# Altium schematic sheet Top-Sheet.SchDoc
size A4; SheetNumber: 1; SheetTotal: 9
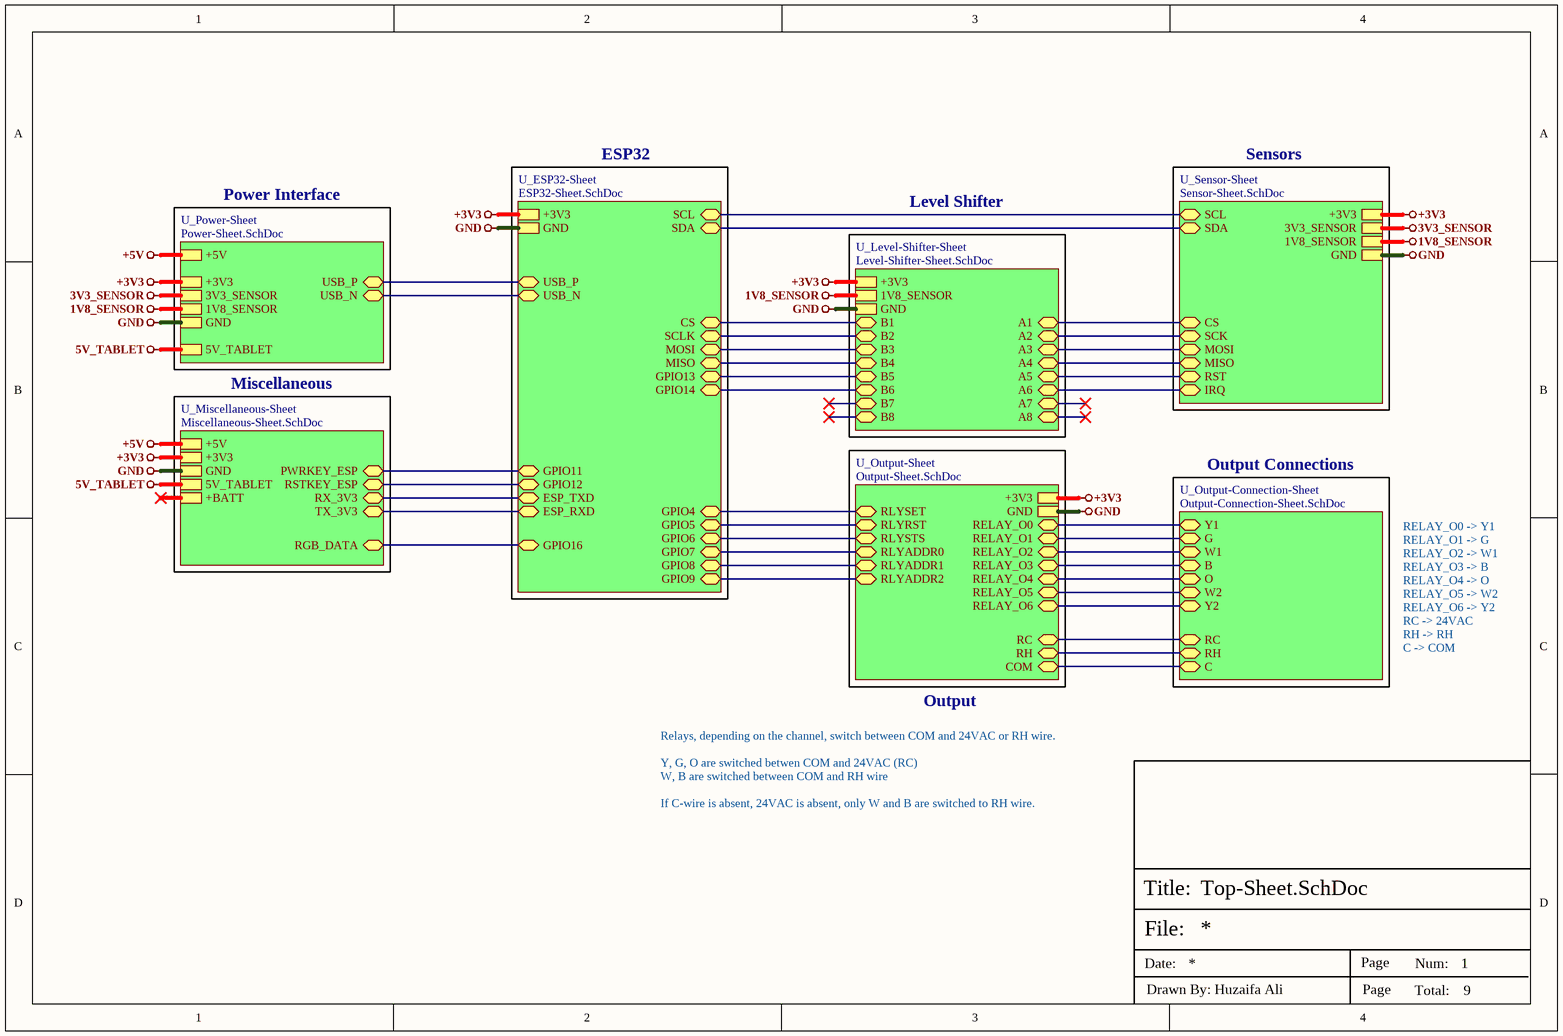
[diagram p0: Top-Sheet.SchDoc]

## Sub-sheets
U_ESP32-Sheet = ESP32-Sheet.SchDoc: +3V3, GND, USB_P (bidir), USB_N (bidir), GPIO11 (bidir), GPIO12 (bidir), ESP_TXD (bidir), ESP_RXD (bidir), GPIO16 (bidir), SCL (bidir), SDA (bidir), CS (bidir), SCLK (bidir), MOSI (bidir), MISO (bidir), GPIO13 (bidir), GPIO14 (bidir), GPIO4 (bidir), GPIO5 (bidir), GPIO6 (bidir), GPIO7 (bidir), GPIO8 (bidir), GPIO9 (bidir)
U_Level-Shifter-Sheet = Level-Shifter-Sheet.SchDoc: +3V3, 1V8_SENSOR, GND, A1 (bidir), A2 (bidir), A3 (bidir), A4 (bidir), A5 (bidir), A6 (bidir), A7 (bidir), A8 (bidir), B1 (bidir), B2 (bidir), B3 (bidir), B4 (bidir), B5 (bidir), B6 (bidir), B7 (bidir), B8 (bidir)
U_Miscellaneous-Sheet = Miscellaneous-Sheet.SchDoc: +5V, +3V3, GND, 5V_TABLET, PWRKEY_ESP (bidir), RSTKEY_ESP (bidir), RX_3V3 (bidir), TX_3V3 (bidir), RGB_DATA (bidir), +BATT
U_Output-Connection-Sheet = Output-Connection-Sheet.SchDoc: Y1 (bidir), G (bidir), W1 (bidir), RC (bidir), RH (bidir), B (bidir), O (bidir), W2 (bidir), Y2 (bidir), C (bidir)
U_Output-Sheet = Output-Sheet.SchDoc: +3V3, GND, RLYSET (bidir), RLYRST (bidir), RLYSTS (bidir), RLYADDR0 (bidir), RLYADDR1 (bidir), RLYADDR2 (bidir), RELAY_O0 (bidir), RELAY_O1 (bidir), RELAY_O2 (bidir), RELAY_O3 (bidir), RELAY_O4 (bidir), RELAY_O5 (bidir), RELAY_O6 (bidir), RC (bidir), RH (bidir), COM (bidir)
U_Power-Sheet = Power-Sheet.SchDoc: +5V, 5V_TABLET, +3V3, 3V3_SENSOR, 1V8_SENSOR, GND, USB_P (bidir), USB_N (bidir)
U_Sensor-Sheet = Sensor-Sheet.SchDoc: +3V3, 3V3_SENSOR, 1V8_SENSOR, GND, SDA (bidir), SCL (bidir), IRQ (bidir), RST (bidir), CS (bidir), SCK (bidir), MOSI (bidir), MISO (bidir)

## Nets
1V8_SENSOR: sheet U_Power-Sheet/1V8_SENSOR, sheet U_Sensor-Sheet/1V8_SENSOR, sheet U_Level-Shifter-Sheet/1V8_SENSOR
3V3_SENSOR: sheet U_Power-Sheet/3V3_SENSOR, sheet U_Sensor-Sheet/3V3_SENSOR
5V_TABLET: sheet U_Power-Sheet/5V_TABLET, sheet U_Miscellaneous-Sheet/5V_TABLET
+3V3: sheet U_Power-Sheet/+3V3, sheet U_Sensor-Sheet/+3V3, sheet U_Output-Sheet/+3V3, sheet U_Level-Shifter-Sheet/+3V3, sheet U_ESP32-Sheet/+3V3, sheet U_Miscellaneous-Sheet/+3V3
+5V: sheet U_Power-Sheet/+5V, sheet U_Miscellaneous-Sheet/+5V
GND: sheet U_Power-Sheet/GND, sheet U_Sensor-Sheet/GND, sheet U_Output-Sheet/GND, sheet U_Level-Shifter-Sheet/GND, sheet U_ESP32-Sheet/GND, sheet U_Miscellaneous-Sheet/GND
(unnamed): sheet U_Power-Sheet/USB_P, sheet U_ESP32-Sheet/USB_P
(unnamed): sheet U_Power-Sheet/USB_N, sheet U_ESP32-Sheet/USB_N
(unnamed): sheet U_Sensor-Sheet/SDA, sheet U_ESP32-Sheet/SDA
(unnamed): sheet U_Sensor-Sheet/SCL, sheet U_ESP32-Sheet/SCL
(unnamed): sheet U_Sensor-Sheet/IRQ, sheet U_Level-Shifter-Sheet/A6
(unnamed): sheet U_Sensor-Sheet/RST, sheet U_Level-Shifter-Sheet/A5
(unnamed): sheet U_Sensor-Sheet/CS, sheet U_Level-Shifter-Sheet/A1
(unnamed): sheet U_Sensor-Sheet/SCK, sheet U_Level-Shifter-Sheet/A2
(unnamed): sheet U_Sensor-Sheet/MOSI, sheet U_Level-Shifter-Sheet/A3
(unnamed): sheet U_Sensor-Sheet/MISO, sheet U_Level-Shifter-Sheet/A4
(unnamed): sheet U_Output-Sheet/RLYSET, sheet U_ESP32-Sheet/GPIO4
(unnamed): sheet U_Output-Sheet/RLYRST, sheet U_ESP32-Sheet/GPIO5
(unnamed): sheet U_Output-Sheet/RLYSTS, sheet U_ESP32-Sheet/GPIO6
(unnamed): sheet U_Output-Sheet/RLYADDR0, sheet U_ESP32-Sheet/GPIO7
(unnamed): sheet U_Output-Sheet/RLYADDR1, sheet U_ESP32-Sheet/GPIO8
(unnamed): sheet U_Output-Sheet/RLYADDR2, sheet U_ESP32-Sheet/GPIO9
(unnamed): sheet U_Output-Sheet/RELAY_O0, sheet U_Output-Connection-Sheet/Y1
(unnamed): sheet U_Output-Sheet/RELAY_O1, sheet U_Output-Connection-Sheet/G
(unnamed): sheet U_Output-Sheet/RELAY_O2, sheet U_Output-Connection-Sheet/W1
(unnamed): sheet U_Output-Sheet/RELAY_O3, sheet U_Output-Connection-Sheet/B
(unnamed): sheet U_Output-Sheet/RELAY_O4, sheet U_Output-Connection-Sheet/O
(unnamed): sheet U_Output-Sheet/RELAY_O5, sheet U_Output-Connection-Sheet/W2
(unnamed): sheet U_Output-Sheet/RELAY_O6, sheet U_Output-Connection-Sheet/Y2
(unnamed): sheet U_Output-Sheet/RC, sheet U_Output-Connection-Sheet/RC
(unnamed): sheet U_Output-Sheet/RH, sheet U_Output-Connection-Sheet/RH
(unnamed): sheet U_Output-Sheet/COM, sheet U_Output-Connection-Sheet/C
(unnamed): sheet U_Level-Shifter-Sheet/B1, sheet U_ESP32-Sheet/CS
(unnamed): sheet U_Level-Shifter-Sheet/B2, sheet U_ESP32-Sheet/SCLK
(unnamed): sheet U_Level-Shifter-Sheet/B3, sheet U_ESP32-Sheet/MOSI
(unnamed): sheet U_Level-Shifter-Sheet/B4, sheet U_ESP32-Sheet/MISO
(unnamed): sheet U_Level-Shifter-Sheet/B5, sheet U_ESP32-Sheet/GPIO13
(unnamed): sheet U_Level-Shifter-Sheet/B6, sheet U_ESP32-Sheet/GPIO14
(unnamed): sheet U_ESP32-Sheet/GPIO11, sheet U_Miscellaneous-Sheet/PWRKEY_ESP
(unnamed): sheet U_ESP32-Sheet/GPIO12, sheet U_Miscellaneous-Sheet/RSTKEY_ESP
(unnamed): sheet U_ESP32-Sheet/ESP_TXD, sheet U_Miscellaneous-Sheet/RX_3V3
(unnamed): sheet U_ESP32-Sheet/ESP_RXD, sheet U_Miscellaneous-Sheet/TX_3V3
(unnamed): sheet U_ESP32-Sheet/GPIO16, sheet U_Miscellaneous-Sheet/RGB_DATA

## Notes on the sheet
- ESP32
- Sensors
- Power Interface
- Level Shifter
- Miscellaneous
- Output Connections
- RELAY_O0 -> Y1
  RELAY_O1 -> G
  RELAY_O2 -> W1
  RELAY_O3 -> B
  RELAY_O4 -> O
  RELAY_O5 -> W2
  RELAY_O6 -> Y2
  RC -> 24VAC
  RH -> RH
  C -> COM
- Output
- Relays, depending on the channel, switch between COM and 24VAC or RH wire.
  Y, G, O are switched betwen COM and 24VAC (RC)
  W, B are switched between COM and RH wire
  If C-wire is absent, 24VAC is absent, only W and B are switched to RH wire.
- File:
- Title:
- Date:
- Page
- Num:
- Total:
- Drawn By: Huzaifa Ali